# Altium project FoxSky.Janus.PrjPcb
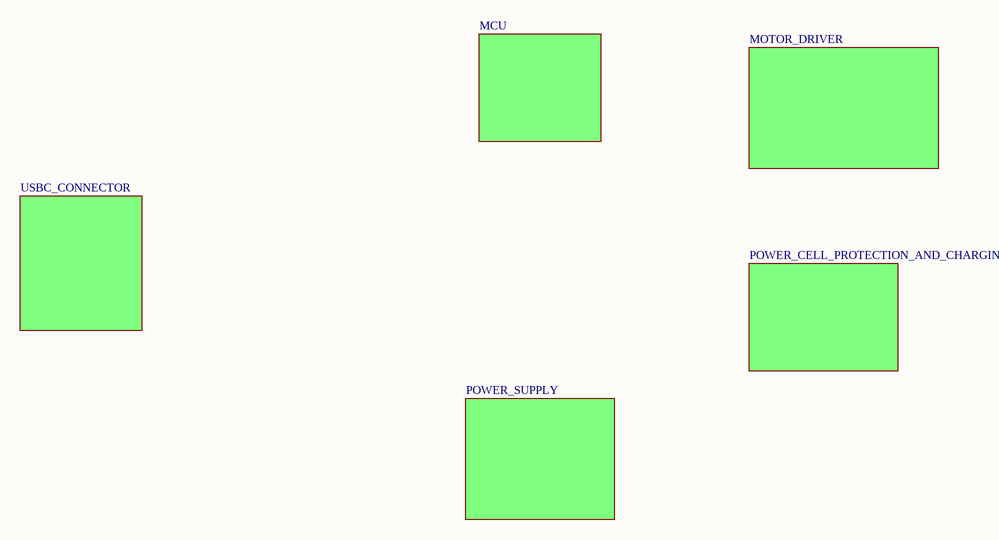
[diagram p0: FoxSky.Janus.SchDoc]
6 sheets, 54 parts. Net scope: flat (ports and power ports of the same name join across sheets).
Sheets:
  FoxSky.Janus.SchDoc
    Designator = MCU.SchDoc
    Designator = POWER_CELL_PROTECTION_AND_CHARGING.SchDoc
    Designator = POWER_SUPPLY.SchDoc
    Designator = MOTOR_DRIVER.SchDoc
    Designator = USBC_CONNECTOR.SchDoc

## Sheet FoxSky.Janus.SchDoc
size A4; SheetNumber: 1; SheetTotal: 6

### Sub-sheets
Designator = MCU: no entries
Designator = POWER_CELL_PROTECTION_AND_CHARGING: no entries
Designator = POWER_SUPPLY: no entries
Designator = MOTOR_DRIVER: no entries
Designator = USBC_CONNECTOR: no entries

## Sheet MCU.SchDoc
size A4; SheetNumber: 2; SheetTotal: 5
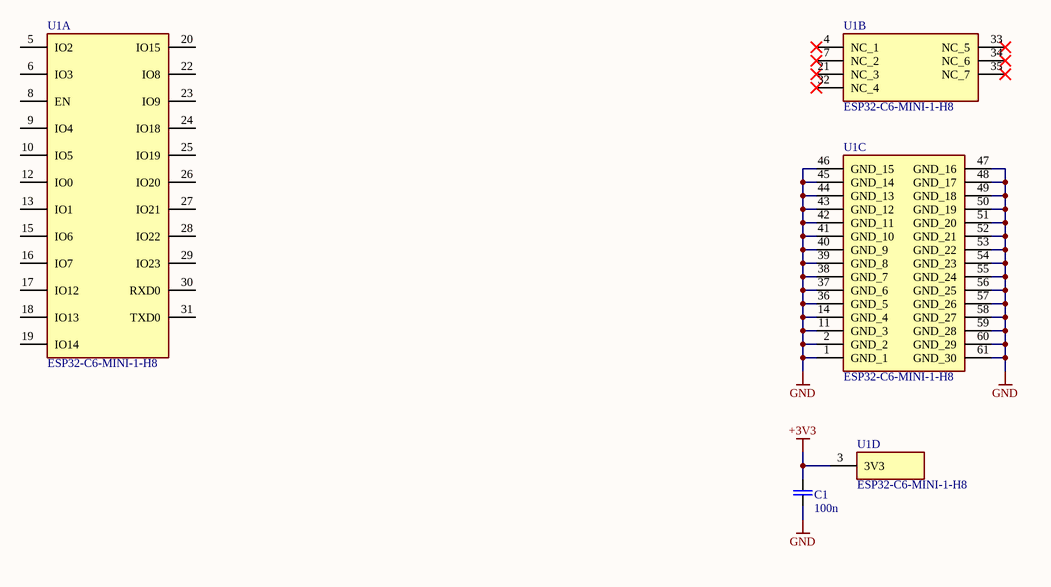
[diagram p1: MCU.SchDoc]

### Parts
C1  100n  [C0402]
U1  ESP32-C6-MINI-1-H8  [ESP32C6MINI1H8]  (parts A,B,C,D of 4)

### Nets
+3V3: C1.2 U1.3(3V3)
GND: C1.1 U1.1(GND_1) U1.2(GND_2) U1.11(GND_3) U1.14(GND_4) U1.36(GND_5) U1.37(GND_6) U1.38(GND_7) U1.39(GND_8) U1.40(GND_9) U1.41(GND_10) U1.42(GND_11) U1.43(GND_12) U1.44(GND_13) U1.45(GND_14) U1.46(GND_15) U1.47(GND_16) U1.48(GND_17) U1.49(GND_18) U1.50(GND_19) U1.51(GND_20) U1.52(GND_21) U1.53(GND_22) U1.54(GND_23) U1.55(GND_24) U1.56(GND_25) U1.57(GND_26) U1.58(GND_27) U1.59(GND_28) U1.60(GND_29) U1.61(GND_30)

Not connected (* = marked no-connect by the designer): U1 4(NC_1)* 5(IO2) 6(IO3) 7(NC_2)* 8(EN) 9(IO4) 10(IO5) 12(IO0) 13(IO1) 15(IO6) 16(IO7) 17(IO12) 18(IO13) 19(IO14) 20(IO15) 21(NC_3)* 22(IO8) 23(IO9) 24(IO18) 25(IO19) 26(IO20) 27(IO21) 28(IO22) 29(IO23) 30(RXD0) 31(TXD0) 32(NC_4)* 33(NC_5)* 34(NC_6)* 35(NC_7)*

### Library data of the parts
C1 = CMP-00023-15: Generic SMD 0402 Ceramic Capacitor
U1 = ESP32-C6-MINI-1-H8: 8 MB (Quad SPI) , 13.2  16.6  2.4 , 3.0 ~ 3.6 V , 2.4 GHz , 2412 ~ 2484 MHz , 40C ~ 105C; Manufacturer_Name: Espressif Systems; Geometry.Height: 2.55mm; Mouser Part Number: 356-ESP32C6MINI1H8; Mouser Price/Stock: https://www.mouser.co.uk/ProductDetail/Espressif-Systems/ESP32-C6-MINI-1-H8?qs=olJun0bQHM8q1UR%2FHSWi2A%3D%3D; Manufacturer_Part_Number: ESP32-C6-MINI-1-H8; Datasheet Link: https://www.mouser.ph/ProductDetail/Espressif-Systems/ESP32-C6-MINI-1-H8?qs=olJun0bQHM8q1UR%2FHSWi2A%3D%3D

## Sheet POWER_CELL_PROTECTION_AND_CHARGING.SchDoc
size A4; SheetNumber: 3; SheetTotal: 5
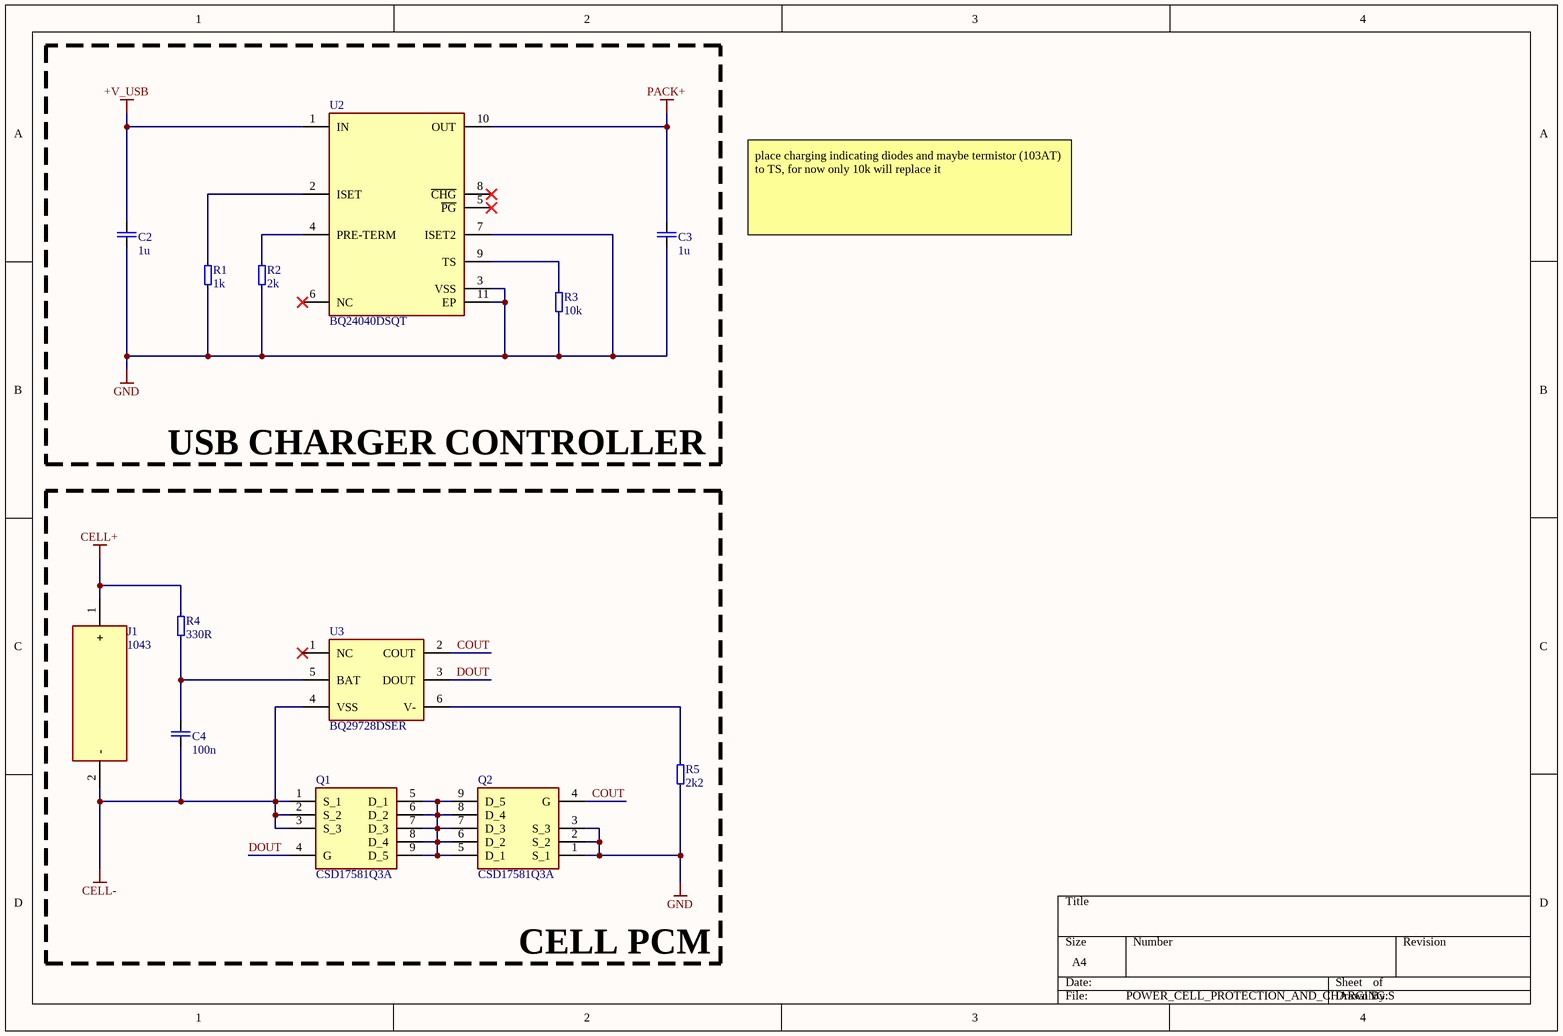
[diagram p2: POWER_CELL_PROTECTION_AND_CHARGING.SchDoc]

### Parts
C2  1u  [C0603]
C3  1u  [C0603]
C4  100n  [C0402]
J1  1043  [1043_KEY]
Q1  CSD17581Q3A  [CSD17581Q3A]
Q2  CSD17581Q3A  [CSD17581Q3A]
R1  1k  [R0402]
R2  2k  [R0402]
R3  10k  [R0402]
R4  330R  [R0402]
R5  2k2  [R0402]
U2  BQ24040DSQT  [SON40P200X200X80-11N]
U3  BQ29728DSER  [TPS610985DSET]

### Blocks framed on the sheet
USB CHARGER CONTROLLER: C2 C3 R1-R3 U2
CELL PCM: C4 J1 Q1 Q2 R4 R5 U3

### Nets
+V_USB: C2.2 U2.1(IN)
CELL+: J1.1(+) R4.2
CELL-: C4.1 J1.2(-) Q1.1(S_1) Q1.2(S_2) Q1.3(S_3) U3.4(VSS)
GND: C2.1 C3.1 Q2.1(S_1) Q2.2(S_2) Q2.3(S_3) R1.1 R2.1 R3.1 R5.1 U2.3(VSS) U2.7(ISET2) U2.11(EP)
PACK+: C3.2 U2.10(OUT)
COUT: Q2.4(G) U3.2(COUT)
DOUT: Q1.4(G) U3.3(DOUT)
NetC4_2: C4.2 R4.1 U3.5(BAT)
NetQ1_5: Q1.5(D_1) Q1.6(D_2) Q1.7(D_3) Q1.8(D_4) Q1.9(D_5) Q2.5(D_1) Q2.6(D_2) Q2.7(D_3) Q2.8(D_4) Q2.9(D_5)
NetR1_2: R1.2 U2.2(ISET)
NetR2_2: R2.2 U2.4(PRE-TERM)
NetR3_2: R3.2 U2.9(TS)
NetR5_2: R5.2 U3.6(V-)

Not connected (* = marked no-connect by the designer): U2 5(~{PG})* 6(NC)* 8(~{CHG})*; U3 1(NC)*

### Notes on the sheet
- place charging indicating diodes and maybe termistor (103AT) to TS, for now only 10k will replace it

### Library data of the parts
C2 C3 = CMP-00024-8: Generic 0603 SMD Ceramic Capacitor
C4 = CMP-00023-15: Generic SMD 0402 Ceramic Capacitor
J1 = 1043: Description; Manufacturer_Name: Keystone Electronics; Copyright: Copyright (C) 2026 Ultra Librarian. All rights reserved.; Manufacturer_Part_Number: 1043; RefDes: RefDes; Type: Type
Q1 Q2 = CSD17581Q3A: 30-V, N channel NexFET power MOSFET, single SON 3 mm x 3 mm, 4.7 mOhm; Manufacturer_Name: Texas Instruments; Geometry.Height: 0.9mm; Mouser Part Number: 595-CSD17581Q3A; Mouser Price/Stock: https://www.mouser.co.uk/ProductDetail/Texas-Instruments/CSD17581Q3A?qs=%2FP2Ij7fVdhEBu0ceoVBClg%3D%3D; Manufacturer_Part_Number: CSD17581Q3A; Datasheet Link: https://www.ti.com/product/CSD17581Q3A?utm_source=google&utm_medium=cpc&utm_campaign=app-null-null-GPN_EN-cpc-pf-google-soas_en_cons&utm_content=CSD17581Q3A&ds_k=CSD17581Q3A&DCM=yes&gclsrc=aw.ds&gad_source=1&gad_campaignid=8753799319&gbraid=0AAAAAC068F0J1
R1-R5 = CMP-00016-11: Generic 0402 SMD Resistor
U2 = BQ24040DSQT: 1A 1-Cell Li-Ion Battery Charger WSON10 Texas Instruments BQ24040DSQT, Battery Charge Controller, 1000mA, 10-Pin SON; Geometry.Height: 0.8mm; Mouser Part Number: 595-BQ24040DSQT; Mouser Price/Stock: https://www.mouser.co.uk/ProductDetail/Texas-Instruments/BQ24040DSQT?qs=c7TMWs5treRrgyn%2F898iNQ%3D%3D; Manufacturer_Name: Texas Instruments; Manufacturer_Part_Number: BQ24040DSQT; Datasheet Link: http://www.ti.com/lit/ds/symlink/bq24040.pdf
U3 = BQ29728DSER: PCM IC; Manufacturer_Name: Texas Instruments; Manufacturer_Part_Number: BQ29707DSET; Datasheet Link: http://www.ti.com/lit/ds/symlink/bq2970.pdf; Height: 0.8mm; Mouser Part Number: 595-BQ29707DSET; Mouser Price/Stock: https://www.mouser.co.uk/ProductDetail/Texas-Instruments/BQ29707DSET?qs=7z%252BmIopC6%2FK8PFHAGER5Bg%3D%3D; Arrow Part Number: BQ29707DSET; Arrow Price/Stock: https://www.arrow.com/en/products/bq29707dset/texas-instruments.html?utm_currency=USD&region=nac

## Sheet POWER_SUPPLY.SchDoc
size A4; SheetNumber: 4; SheetTotal: 6
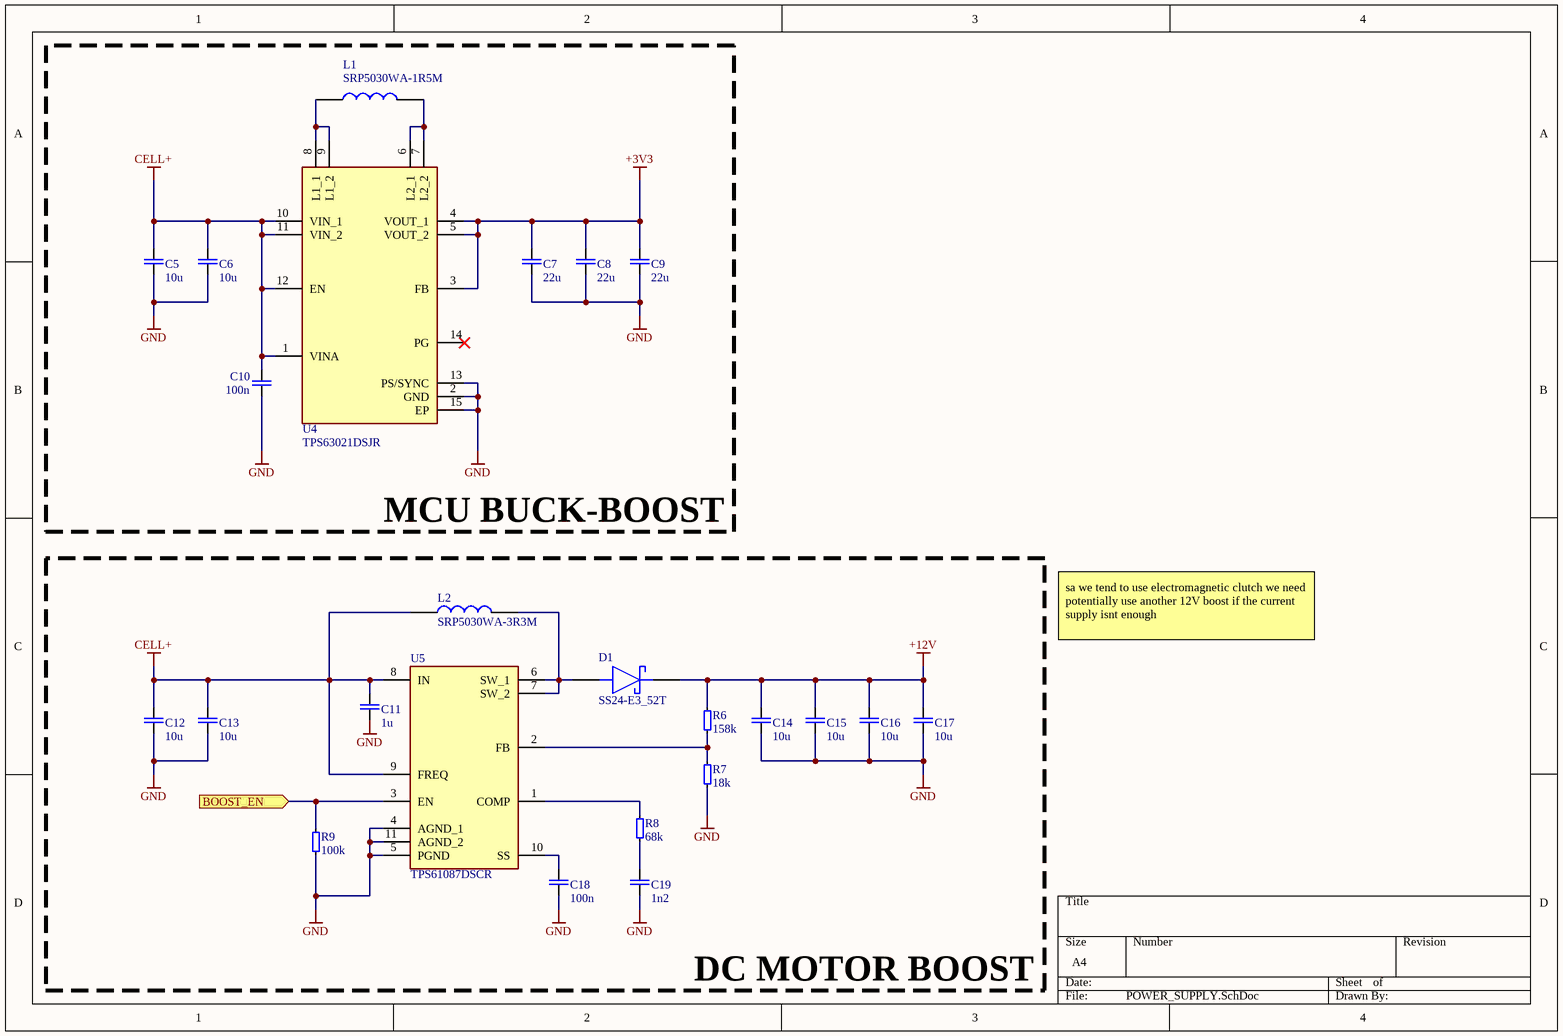
[diagram p3: POWER_SUPPLY.SchDoc]

### Parts
C5  10u  [C0805]
C6  10u  [C0805]
C7  22u  [C1206]
C8  22u  [C1206]
C9  22u  [C1206]
C10  100n  [C0402]
C11  1u  [C0603]
C12  10u  [C0805]
C13  10u  [C0805]
C14  10u  [C1206]
C15  10u  [C1206]
C16  10u  [C1206]
C17  10u  [C1206]
C18  100n  [C0402]
C19  1n2  [C0402]
D1  SS24-E3_52T  [DIOM5436X244N]
L1  SRP5030WA-1R5M  [INDPM5552X300N]
L2  SRP5030WA-3R3M  [INDPM5552X300N]
R6  158k  [R0402]
R7  18k  [R0402]
R8  68k  [R0402]
R9  100k  [R0402]
U4  TPS63021DSJR  [SON50P300X400X100-15N-D]
U5  TPS61087DSCR  [SON50P300X300X80-11N-D]

### Blocks framed on the sheet
MCU BUCK-BOOST: C5-C10 L1 U4
DC MOTOR BOOST: C11-C19 D1 L2 R6-R9 U5

### Ports
BOOST_EN (in)

### Nets
+3V3: C7.2 C8.2 C9.2 U4.3(FB) U4.4(VOUT_1) U4.5(VOUT_2)
+12V: C14.2 C15.2 C16.2 C17.2 D1.1(K) R6.2
CELL+: C5.2 C6.2 C10.2 C11.2 C12.2 C13.2 L2.1 U4.1(VINA) U4.10(VIN_1) U4.11(VIN_2) U4.12(EN) U5.8(IN) U5.9(FREQ)
GND: C5.1 C6.1 C7.1 C8.1 C9.1 C10.1 C11.1 C12.1 C13.1 C14.1 C15.1 C16.1 C17.1 C18.1 C19.1 R7.1 R9.1 U4.2(GND) U4.13(PS/SYNC) U4.15(EP) U5.4(AGND_1) U5.5(PGND) U5.11(AGND_2)
NetC18_2: C18.2 U5.10(SS)
NetC19_2: C19.2 R8.1
NetD1_2: D1.2(A) L2.2 U5.6(SW_1) U5.7(SW_2)
NetL1_1: L1.1 U4.8(L1_1) U4.9(L1_2)
NetL1_2: L1.2 U4.6(L2_1) U4.7(L2_2)
NetR6_1: R6.1 R7.2 U5.2(FB)
NetR8_2: R8.2 U5.1(COMP)
NetR9_2: R9.2 U5.3(EN) ; port BOOST_EN

Not connected (* = marked no-connect by the designer): U4 14(PG)*

### Notes on the sheet
- sa we tend to use electromagnetic clutch we need potentially use another 12V boost if the current supply isnt enough

### Library data of the parts
C5 C6 C12 C13 = CMP-00025-5: Generic 0805 SMD Ceramic Capacitor
C7-C9 C14-C17 = CMP-00026-7: Generic 1206 SMD Ceramic Capacitor
C10 C18 C19 = CMP-00023-15: Generic SMD 0402 Ceramic Capacitor
C11 = CMP-00024-8: Generic 0603 SMD Ceramic Capacitor
D1 = SS24-E3_52T: Schottky Diodes & Rectifiers 2.0 Amp 40 Volt; Manufacturer_Name: Vishay; Manufacturer_Part_Number: SS24-E3/52T; Geometry.Height: 2.44mm; Mouser Part Number: 625-SS24-E3; Mouser Price/Stock: https://www.mouser.co.uk/ProductDetail/Vishay-General-Semiconductor/SS24-E3-52T?qs=x2jpVgRnAtP8XbmaoIr%252Bng%3D%3D; Datasheet Link: https://www.vishay.com/docs/88748/ss22.pdf
L1 = SRP5030WA-1R5M: Ind,5.5x5.25x2.8mm,1.5uH+/-20%,8.5A,shd; Manufacturer_Name: Bourns; Geometry.Height: 3mm; Mouser Part Number: 652-SRP5030WA-1R5M; Mouser Price/Stock: https://www.mouser.co.uk/ProductDetail/Bourns/SRP5030WA-1R5M?qs=9vOqFld9vZVU1hSpR6NGrg%3D%3D; Manufacturer_Part_Number: SRP5030WA-1R5M; Datasheet Link: https://g.componentsearchengine.com/Datasheets/0/17601778.pdf
L2 = SRP5030WA-3R3M: Ind,5.5x5.25x2.8mm,3.3uH+/-20%,6A,shd; Manufacturer_Name: Bourns; Geometry.Height: 3mm; Mouser Part Number: 652-SRP5030WA-3R3M; Mouser Price/Stock: https://www.mouser.co.uk/ProductDetail/Bourns/SRP5030WA-3R3M?qs=9vOqFld9vZVo7qWb%252BEg6NA%3D%3D; Manufacturer_Part_Number: SRP5030WA-3R3M; Datasheet Link: https://www.bourns.com/docs/Product-Datasheets/SRP5030WA.pdf
R6-R9 = CMP-00016-11: Generic 0402 SMD Resistor
U4 = TPS63021DSJR: High Efficiency Single Inductor Buck-Boost Converter with 4A Switch; Manufacturer_Name: Texas Instruments; Geometry.Height: 1mm; Mouser Part Number: 595-TPS63021DSJR; Mouser Price/Stock: https://www.mouser.co.uk/ProductDetail/Texas-Instruments/TPS63021DSJR?qs=C44r%252BX3hXgL5uT9uesn8fg%3D%3D; Manufacturer_Part_Number: TPS63021DSJR; Datasheet Link: http://www.ti.com/lit/gpn/tps63021
U5 = TPS61087DSCR: Conv DC-DC 2.5V to 6V Non-Inv/Inv/Step Up/Step Down Single-Out 3V to 18.5V 3.2A 10-Pin WSON EP T/R; Manufacturer_Name: Texas Instruments; Geometry.Height: 0.8mm; Mouser Part Number: 595-TPS61087DSCR; Mouser Price/Stock: https://www.mouser.co.uk/ProductDetail/Texas-Instruments/TPS61087DSCR?qs=bS0R8qMSxJOWmsgAbsl9FQ%3D%3D; Manufacturer_Part_Number: TPS61087DSCR; Datasheet Link: http://www.ti.com/lit/gpn/tps61087

## Sheet MOTOR_DRIVER.SchDoc
size A4; SheetNumber: 5; SheetTotal: 5
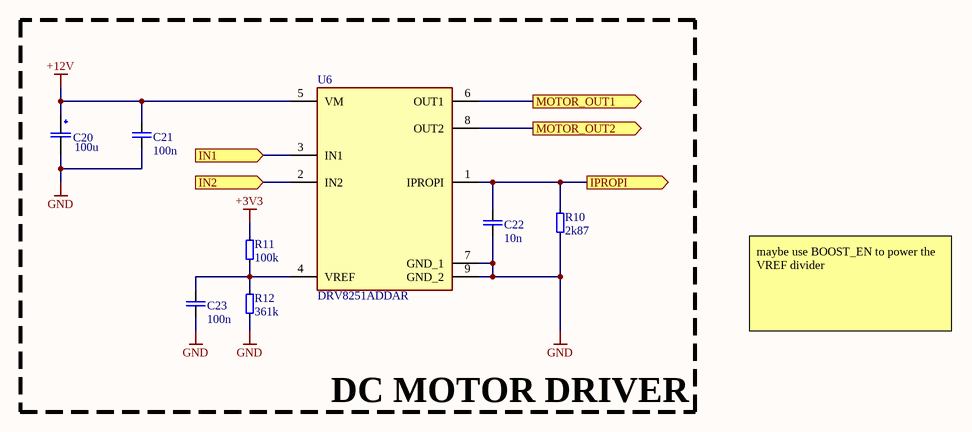
[diagram p4: MOTOR_DRIVER.SchDoc]

### Parts
C20  100u  [CAPAE660X800N]
C21  100n  [C0402]
C22  10n  [C0402]
C23  100n  [C0402]
R10  2k87  [R0402]
R11  100k  [R0402]
R12  361k  [R0402]
U6  DRV8251ADDAR  [SOIC127P600X170-9N]

### Blocks framed on the sheet
DC MOTOR DRIVER: C20-C23 R10-R12 U6

### Ports
IN1 (in), IN2 (in), IPROPI (out), MOTOR_OUT1 (out), MOTOR_OUT2 (out)

### Nets
+3V3: R11.2
+12V: C20.1 C21.2 U6.5(VM)
GND: C20.2 C21.1 C22.1 C23.1 R10.1 R12.1 U6.7(GND_1) U6.9(GND_2)
NetC22_2: C22.2 R10.2 U6.1(IPROPI) ; port IPROPI
NetC23_2: C23.2 R11.1 R12.2 U6.4(VREF)
NetU6_2: U6.2(IN2) ; port IN2
NetU6_3: U6.3(IN1) ; port IN1
NetU6_6: U6.6(OUT1) ; port MOTOR_OUT1
NetU6_8: U6.8(OUT2) ; port MOTOR_OUT2

### Notes on the sheet
- maybe use BOOST_EN to power the VREF divider

### Library data of the parts
C20 = EDK107M025A9HAA: Surface Mount, Aluminum Electrolytic; Manufacturer_Name: Yageo Group; Geometry.Height: 8mm; Mouser Part Number: 80-EDK107M025A9HAA; Mouser Price/Stock: https://www.mouser.co.uk/ProductDetail/KEMET/EDK107M025A9HAA?qs=T9vdlufmP8yf8os%252BKCOQGA%3D%3D; Manufacturer_Part_Number: EDK107M025A9HAA; Datasheet Link: https://www.yageogroup.com/content/datasheet/asset/file/KEM_A4001_EDK
C21-C23 = CMP-00023-15: Generic SMD 0402 Ceramic Capacitor
R10-R12 = CMP-00016-11: Generic 0402 SMD Resistor
U6 = DRV8251ADDAR: Motor Drives 48-V, 3.5-A H bridge motor driver with current regulation and current sense feedback; Manufacturer_Name: Texas Instruments; Geometry.Height: 1.7mm; Mouser Part Number: 595-DRV8251ADDAR; Mouser Price/Stock: https://www.mouser.co.uk/ProductDetail/Texas-Instruments/DRV8251ADDAR?qs=MyNHzdoqoQKQYZTe%252B1jFCw%3D%3D; Manufacturer_Part_Number: DRV8251ADDAR; Datasheet Link: https://www.arrow.com/en/products/drv8251addar/texas-instruments?region=nac

## Sheet USBC_CONNECTOR.SchDoc
size A4; SheetNumber: 6; SheetTotal: 6
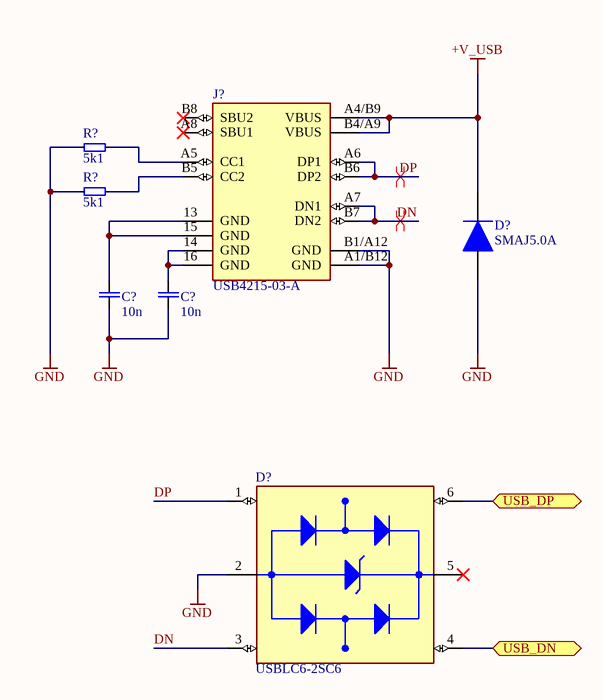
[diagram p5: USBC_CONNECTOR.SchDoc]

### Parts
(Parts that share a designator on the sheet are numbered #1, #2 ... from top to bottom, then left to right.)
C?#1  10n  [C0402]
C?#2  10n  [C0402]
D?#1  SMAJ5.0A  [DIOM5026X229N]
D?#2  USBLC6-2SC6  [SOT95P280X145-6N]
J?  USB4215-03-A  [CONN_8p94X6p5X3p16_12L_GCC]
R?#1  5k1  [R0402]
R?#2  5k1  [R0402]

### Ports
USB_DN (bidir), USB_DP (bidir)

### Nets
+V_USB: D?#1.1(K) J?.A4/B9(VBUS) J?.B4/A9(VBUS)
GND: C?#1.1 C?#2.1 D?#1.2(A) D?#2.2(GND) J?.A1/B12(GND) J?.B1/A12(GND) R?#1.1 R?#2.1
DN: D?#2.3(I/O2_IN) J?.A7(DN1) J?.B7(DN2)
DP: D?#2.1(I/O1_IN) J?.A6(DP1) J?.B6(DP2)
NetC?#1_2: C?#1.2 J?.13(GND) J?.15(GND)
NetC?#2_2: C?#2.2 J?.14(GND) J?.16(GND)
NetD?#2_4: D?#2.4(I/O2_OUT) ; port USB_DN
NetD?#2_6: D?#2.6(I/O1_OUT) ; port USB_DP
NetJ?_A5: J?.A5(CC1) R?#1.2
NetJ?_B5: J?.B5(CC2) R?#2.2

Not connected (* = marked no-connect by the designer): D?#2 5(VBUS)*; J? A8(SBU1)* B8(SBU2)*

### Layout directives
differential pair: DN, DP

### Library data of the parts
C?#1 C?#2 = CMP-00023-15: Generic SMD 0402 Ceramic Capacitor
D?#1 = SMAJ5.0A: BOURNS - SMAJ5.0A - TVS Diode, TRANSZORB SMAJ Series, Unidirectional, 5 V, 9.2 V, DO-214AC (SMA), 2 Pins; Geometry.Height: 2.29mm; Mouser Part Number: 652-SMAJ5.0A; Mouser Price/Stock: https://www.mouser.co.uk/ProductDetail/Bourns/SMAJ5.0A?qs=A3H9pljuJ8RbLIvzFxDfUA%3D%3D; Manufacturer_Name: Bourns; Manufacturer_Part_Number: SMAJ5.0A; Datasheet Link: https://detail.tmall.com/item.htm?id=548354020241&ali_refid=a3_430583_1006:1109983619:N:3Uw9kZ3UMDT/QL57nh1fXA==:ab063b49c94624768a940a913313feb0&ali_trackid=1_ab063b49c94624768a940a913313feb0&spm=a230r.1.14.1
D?#2 = USBLC6-2SC6: 17V Clamp 5A (8/20Âµs) Ipp Tvs Diode Surface Mount SOT-23-6; MF: STMicroelectronics; Value: *; SnapEDA_Link: https://www.snapeda.com/parts/USBLC6-2SC6/STMicroelectronics/view-part/?ref=snap; Check_prices: https://www.snapeda.com/parts/USBLC6-2SC6/STMicroelectronics/view-part/?ref=eda; Purchase-URL: https://pricing.snapeda.com/search/part/USBLC6-2SC6/?ref=eda; Price: None; Availability: In Stock; Package: SOT-23-6 STMicroelectronics; MP: USBLC6-2SC6
J? = USB4215-03-A: Description; Manufacturer_Name: Global Connector Technology; Copyright: Copyright (C) 2026 Ultra Librarian. All rights reserved.; Manufacturer_Part_Number: USB4215-03-A; RefDes: RefDes; Type: Type
R?#1 R?#2 = CMP-00016-11: Generic 0402 SMD Resistor

## Nets that join several sheets
+3V3: MCU (C1.2 U1.3), POWER_SUPPLY (6 pins), MOTOR_DRIVER (R11.2)
+12V: POWER_SUPPLY (6 pins), MOTOR_DRIVER (C20.1 C21.2 U6.5)
+V_USB: POWER_CELL_PROTECTION_AND_CHARGING (C2.2 U2.1), USBC_CONNECTOR (D?#1.1 J?.A4/B9 J?.B4/A9)
CELL+: POWER_CELL_PROTECTION_AND_CHARGING (J1.1 R4.2), POWER_SUPPLY (13 pins)
GND: MCU (31 pins), POWER_CELL_PROTECTION_AND_CHARGING (12 pins), POWER_SUPPLY (23 pins), MOTOR_DRIVER (8 pins), USBC_CONNECTOR (8 pins)